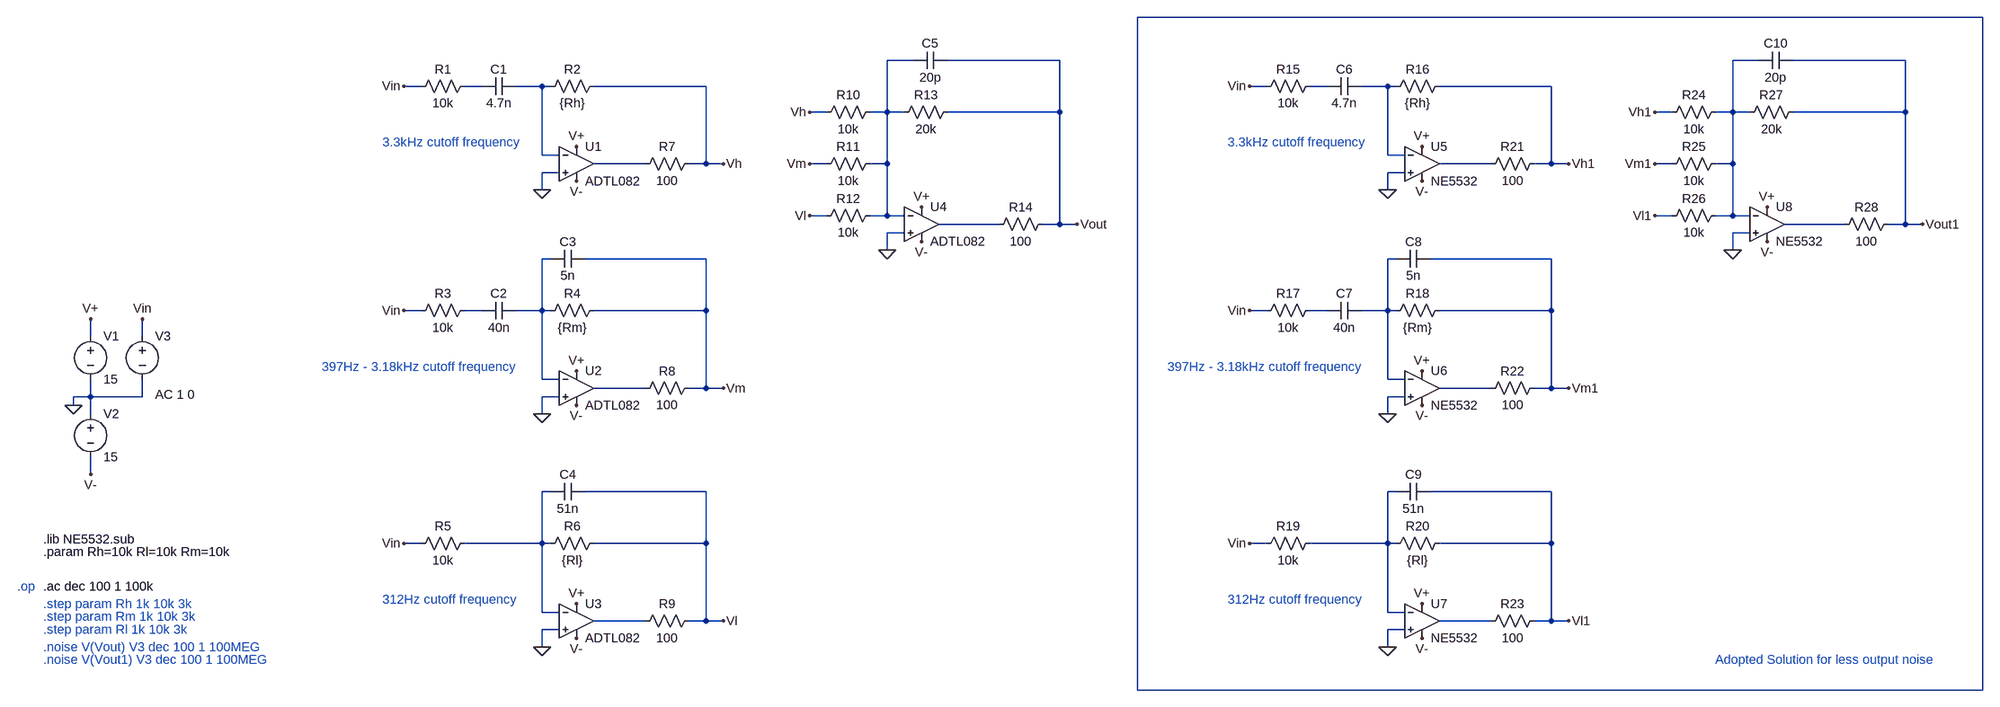
[diagram p0: schematic AudioMixer - 3bEq.asc]
AudioMixer - 3bEq.asc, the LTspice schematic file:
Version 4.1
SHEET 1 2868 2084
WIRE 2864 -576 1296 -576
WIRE 880 -496 832 -496
WIRE 1152 -496 944 -496
WIRE 2448 -496 2400 -496
WIRE 2720 -496 2512 -496
WIRE -32 -448 -64 -448
WIRE 80 -448 48 -448
WIRE 192 -448 144 -448
WIRE 208 -448 192 -448
WIRE 496 -448 288 -448
WIRE 1536 -448 1504 -448
WIRE 1648 -448 1616 -448
WIRE 1760 -448 1712 -448
WIRE 1776 -448 1760 -448
WIRE 2064 -448 1856 -448
WIRE 720 -400 688 -400
WIRE 832 -400 832 -496
WIRE 832 -400 800 -400
WIRE 864 -400 832 -400
WIRE 1152 -400 1152 -496
WIRE 1152 -400 944 -400
WIRE 2288 -400 2256 -400
WIRE 2400 -400 2400 -496
WIRE 2400 -400 2368 -400
WIRE 2432 -400 2400 -400
WIRE 2720 -400 2720 -496
WIRE 2720 -400 2512 -400
WIRE 192 -320 192 -448
WIRE 224 -320 192 -320
WIRE 1760 -320 1760 -448
WIRE 1792 -320 1760 -320
WIRE 384 -304 288 -304
WIRE 496 -304 496 -448
WIRE 496 -304 464 -304
WIRE 528 -304 496 -304
WIRE 720 -304 688 -304
WIRE 832 -304 832 -400
WIRE 832 -304 800 -304
WIRE 1952 -304 1856 -304
WIRE 2064 -304 2064 -448
WIRE 2064 -304 2032 -304
WIRE 2096 -304 2064 -304
WIRE 2288 -304 2256 -304
WIRE 2400 -304 2400 -400
WIRE 2400 -304 2368 -304
WIRE 224 -288 192 -288
WIRE 1792 -288 1760 -288
WIRE 192 -256 192 -288
WIRE 1760 -256 1760 -288
WIRE 720 -208 688 -208
WIRE 832 -208 832 -304
WIRE 832 -208 800 -208
WIRE 864 -208 832 -208
WIRE 2288 -208 2256 -208
WIRE 2400 -208 2400 -304
WIRE 2400 -208 2368 -208
WIRE 2432 -208 2400 -208
WIRE 1040 -192 928 -192
WIRE 1152 -192 1152 -400
WIRE 1152 -192 1120 -192
WIRE 1184 -192 1152 -192
WIRE 2608 -192 2496 -192
WIRE 2720 -192 2720 -400
WIRE 2720 -192 2688 -192
WIRE 2752 -192 2720 -192
WIRE 864 -176 832 -176
WIRE 2432 -176 2400 -176
WIRE 832 -144 832 -176
WIRE 2400 -144 2400 -176
WIRE 208 -128 192 -128
WIRE 496 -128 272 -128
WIRE 1776 -128 1760 -128
WIRE 2064 -128 1840 -128
WIRE -32 -32 -64 -32
WIRE 80 -32 48 -32
WIRE 192 -32 192 -128
WIRE 192 -32 144 -32
WIRE 208 -32 192 -32
WIRE 496 -32 496 -128
WIRE 496 -32 288 -32
WIRE 1536 -32 1504 -32
WIRE 1648 -32 1616 -32
WIRE 1760 -32 1760 -128
WIRE 1760 -32 1712 -32
WIRE 1776 -32 1760 -32
WIRE 2064 -32 2064 -128
WIRE 2064 -32 1856 -32
WIRE -832 16 -832 -16
WIRE -736 16 -736 -16
WIRE 192 96 192 -32
WIRE 224 96 192 96
WIRE 1760 96 1760 -32
WIRE 1792 96 1760 96
WIRE 384 112 288 112
WIRE 496 112 496 -32
WIRE 496 112 464 112
WIRE 528 112 496 112
WIRE 1952 112 1856 112
WIRE 2064 112 2064 -32
WIRE 2064 112 2032 112
WIRE 2096 112 2064 112
WIRE -832 128 -832 96
WIRE -832 128 -864 128
WIRE -736 128 -736 96
WIRE -736 128 -832 128
WIRE 224 128 192 128
WIRE 1792 128 1760 128
WIRE -864 144 -864 128
WIRE -832 160 -832 128
WIRE 192 160 192 128
WIRE 1760 160 1760 128
WIRE -832 272 -832 240
WIRE 208 304 192 304
WIRE 496 304 272 304
WIRE 1776 304 1760 304
WIRE 2064 304 1840 304
WIRE -32 400 -64 400
WIRE 192 400 192 304
WIRE 192 400 48 400
WIRE 208 400 192 400
WIRE 496 400 496 304
WIRE 496 400 288 400
WIRE 1536 400 1504 400
WIRE 1760 400 1760 304
WIRE 1760 400 1616 400
WIRE 1776 400 1760 400
WIRE 2064 400 2064 304
WIRE 2064 400 1856 400
WIRE 192 528 192 400
WIRE 224 528 192 528
WIRE 1760 528 1760 400
WIRE 1792 528 1760 528
WIRE 384 544 288 544
WIRE 496 544 496 400
WIRE 496 544 464 544
WIRE 528 544 496 544
WIRE 1952 544 1856 544
WIRE 2064 544 2064 400
WIRE 2064 544 2032 544
WIRE 2096 544 2064 544
WIRE 224 560 192 560
WIRE 1792 560 1760 560
WIRE 192 592 192 560
WIRE 1760 592 1760 560
WIRE 1296 672 1296 -576
WIRE 2864 672 2864 -576
WIRE 2864 672 1296 672
FLAG -864 144 0
FLAG -832 -16 V+
FLAG -832 272 V-
FLAG 256 -336 V+
FLAG 256 -272 V-
FLAG -736 -16 Vin
FLAG -64 -448 Vin
FLAG 528 -304 Vh
FLAG 192 -256 0
FLAG 256 80 V+
FLAG 256 144 V-
FLAG -64 -32 Vin
FLAG 192 160 0
FLAG 256 512 V+
FLAG 256 576 V-
FLAG -64 400 Vin
FLAG 192 592 0
FLAG 896 -224 V+
FLAG 896 -160 V-
FLAG 832 -144 0
FLAG 528 112 Vm
FLAG 528 544 Vl
FLAG 688 -400 Vh
FLAG 688 -304 Vm
FLAG 688 -208 Vl
FLAG 1824 -336 V+
FLAG 1824 -272 V-
FLAG 1504 -448 Vin
FLAG 2096 -304 Vh1
FLAG 1760 -256 0
FLAG 1824 80 V+
FLAG 1824 144 V-
FLAG 1504 -32 Vin
FLAG 1760 160 0
FLAG 1824 512 V+
FLAG 1824 576 V-
FLAG 1504 400 Vin
FLAG 1760 592 0
FLAG 2464 -224 V+
FLAG 2464 -160 V-
FLAG 2400 -144 0
FLAG 2096 112 Vm1
FLAG 2096 544 Vl1
FLAG 2752 -192 Vout1
FLAG 2256 -400 Vh1
FLAG 2256 -304 Vm1
FLAG 2256 -208 Vl1
FLAG 1184 -192 Vout
SYMBOL OpAmps\\ADTL082 256 -368 R0
SYMATTR InstName U1
SYMBOL voltage -832 0 R0
SYMATTR InstName V1
SYMATTR Value 15
SYMBOL voltage -832 144 R0
SYMATTR InstName V2
SYMATTR Value 15
SYMBOL voltage -736 0 R0
WINDOW 123 24 124 Left 2
WINDOW 39 0 0 Left 0
SYMATTR Value2 AC 1 0
SYMATTR InstName V3
SYMATTR Value ""
SYMBOL res 64 -464 R90
WINDOW 0 0 56 VBottom 2
WINDOW 3 32 56 VTop 2
SYMATTR InstName R1
SYMATTR Value 10k
SYMBOL cap 144 -464 R90
WINDOW 0 0 32 VBottom 2
WINDOW 3 32 32 VTop 2
SYMATTR InstName C1
SYMATTR Value 4.7n
SYMBOL res 304 -464 R90
WINDOW 0 0 56 VBottom 2
WINDOW 3 32 56 VTop 2
SYMATTR InstName R2
SYMATTR Value {Rh}
SYMBOL OpAmps\\ADTL082 256 48 R0
SYMATTR InstName U2
SYMBOL res 64 -48 R90
WINDOW 0 0 56 VBottom 2
WINDOW 3 32 56 VTop 2
SYMATTR InstName R3
SYMATTR Value 10k
SYMBOL cap 144 -48 R90
WINDOW 0 0 32 VBottom 2
WINDOW 3 32 32 VTop 2
SYMATTR InstName C2
SYMATTR Value 40n
SYMBOL res 304 -48 R90
WINDOW 0 0 56 VBottom 2
WINDOW 3 32 56 VTop 2
SYMATTR InstName R4
SYMATTR Value {Rm}
SYMBOL cap 272 -144 R90
WINDOW 0 0 32 VBottom 2
WINDOW 3 32 32 VTop 2
SYMATTR InstName C3
SYMATTR Value 5n
SYMBOL OpAmps\\ADTL082 256 480 R0
SYMATTR InstName U3
SYMBOL res 64 384 R90
WINDOW 0 0 56 VBottom 2
WINDOW 3 32 56 VTop 2
SYMATTR InstName R5
SYMATTR Value 10k
SYMBOL res 304 384 R90
WINDOW 0 0 56 VBottom 2
WINDOW 3 32 56 VTop 2
SYMATTR InstName R6
SYMATTR Value {Rl}
SYMBOL cap 272 288 R90
WINDOW 0 0 32 VBottom 2
WINDOW 3 32 32 VTop 2
SYMATTR InstName C4
SYMATTR Value 51n
SYMBOL OpAmps\\ADTL082 896 -256 R0
SYMATTR InstName U4
SYMBOL res 480 -320 R90
WINDOW 0 0 56 VBottom 2
WINDOW 3 32 56 VTop 2
SYMATTR InstName R7
SYMATTR Value 100
SYMBOL res 480 96 R90
WINDOW 0 0 56 VBottom 2
WINDOW 3 32 56 VTop 2
SYMATTR InstName R8
SYMATTR Value 100
SYMBOL res 480 528 R90
WINDOW 0 0 56 VBottom 2
WINDOW 3 32 56 VTop 2
SYMATTR InstName R9
SYMATTR Value 100
SYMBOL res 816 -416 R90
WINDOW 0 0 56 VBottom 2
WINDOW 3 32 56 VTop 2
SYMATTR InstName R10
SYMATTR Value 10k
SYMBOL res 816 -320 R90
WINDOW 0 0 56 VBottom 2
WINDOW 3 32 56 VTop 2
SYMATTR InstName R11
SYMATTR Value 10k
SYMBOL res 816 -224 R90
WINDOW 0 0 56 VBottom 2
WINDOW 3 32 56 VTop 2
SYMATTR InstName R12
SYMATTR Value 10k
SYMBOL res 960 -416 R90
WINDOW 0 0 56 VBottom 2
WINDOW 3 32 56 VTop 2
SYMATTR InstName R13
SYMATTR Value 20k
SYMBOL cap 944 -512 R90
WINDOW 0 0 32 VBottom 2
WINDOW 3 32 32 VTop 2
SYMATTR InstName C5
SYMATTR Value 20p
SYMBOL res 1136 -208 R90
WINDOW 0 0 56 VBottom 2
WINDOW 3 32 56 VTop 2
SYMATTR InstName R14
SYMATTR Value 100
SYMBOL res 1632 -464 R90
WINDOW 0 0 56 VBottom 2
WINDOW 3 32 56 VTop 2
SYMATTR InstName R15
SYMATTR Value 10k
SYMBOL cap 1712 -464 R90
WINDOW 0 0 32 VBottom 2
WINDOW 3 32 32 VTop 2
SYMATTR InstName C6
SYMATTR Value 4.7n
SYMBOL res 1872 -464 R90
WINDOW 0 0 56 VBottom 2
WINDOW 3 32 56 VTop 2
SYMATTR InstName R16
SYMATTR Value {Rh}
SYMBOL res 1632 -48 R90
WINDOW 0 0 56 VBottom 2
WINDOW 3 32 56 VTop 2
SYMATTR InstName R17
SYMATTR Value 10k
SYMBOL cap 1712 -48 R90
WINDOW 0 0 32 VBottom 2
WINDOW 3 32 32 VTop 2
SYMATTR InstName C7
SYMATTR Value 40n
SYMBOL res 1872 -48 R90
WINDOW 0 0 56 VBottom 2
WINDOW 3 32 56 VTop 2
SYMATTR InstName R18
SYMATTR Value {Rm}
SYMBOL cap 1840 -144 R90
WINDOW 0 0 32 VBottom 2
WINDOW 3 32 32 VTop 2
SYMATTR InstName C8
SYMATTR Value 5n
SYMBOL res 1632 384 R90
WINDOW 0 0 56 VBottom 2
WINDOW 3 32 56 VTop 2
SYMATTR InstName R19
SYMATTR Value 10k
SYMBOL res 1872 384 R90
WINDOW 0 0 56 VBottom 2
WINDOW 3 32 56 VTop 2
SYMATTR InstName R20
SYMATTR Value {Rl}
SYMBOL cap 1840 288 R90
WINDOW 0 0 32 VBottom 2
WINDOW 3 32 32 VTop 2
SYMATTR InstName C9
SYMATTR Value 51n
SYMBOL res 2048 -320 R90
WINDOW 0 0 56 VBottom 2
WINDOW 3 32 56 VTop 2
SYMATTR InstName R21
SYMATTR Value 100
SYMBOL res 2048 96 R90
WINDOW 0 0 56 VBottom 2
WINDOW 3 32 56 VTop 2
SYMATTR InstName R22
SYMATTR Value 100
SYMBOL res 2048 528 R90
WINDOW 0 0 56 VBottom 2
WINDOW 3 32 56 VTop 2
SYMATTR InstName R23
SYMATTR Value 100
SYMBOL res 2384 -416 R90
WINDOW 0 0 56 VBottom 2
WINDOW 3 32 56 VTop 2
SYMATTR InstName R24
SYMATTR Value 10k
SYMBOL res 2384 -320 R90
WINDOW 0 0 56 VBottom 2
WINDOW 3 32 56 VTop 2
SYMATTR InstName R25
SYMATTR Value 10k
SYMBOL res 2384 -224 R90
WINDOW 0 0 56 VBottom 2
WINDOW 3 32 56 VTop 2
SYMATTR InstName R26
SYMATTR Value 10k
SYMBOL res 2528 -416 R90
WINDOW 0 0 56 VBottom 2
WINDOW 3 32 56 VTop 2
SYMATTR InstName R27
SYMATTR Value 20k
SYMBOL cap 2512 -512 R90
WINDOW 0 0 32 VBottom 2
WINDOW 3 32 32 VTop 2
SYMATTR InstName C10
SYMATTR Value 20p
SYMBOL res 2704 -208 R90
WINDOW 0 0 56 VBottom 2
WINDOW 3 32 56 VTop 2
SYMATTR InstName R28
SYMATTR Value 100
SYMBOL OpAmps\\opamp2 1824 -368 R0
SYMATTR InstName U5
SYMATTR Value NE5532
SYMBOL OpAmps\\opamp2 1824 48 R0
SYMATTR InstName U6
SYMATTR Value NE5532
SYMBOL OpAmps\\opamp2 1824 480 R0
SYMATTR InstName U7
SYMATTR Value NE5532
SYMBOL OpAmps\\opamp2 2464 -256 R0
SYMATTR InstName U8
SYMATTR Value NE5532
TEXT -920 480 Left 2 !.ac dec 100 1 100k
TEXT -920 416 Left 2 !.param Rh=10k Rl=10k Rm=10k
TEXT -920 512 Left 2 ;.step param Rh 1k 10k 3k
TEXT -920 536 Left 2 ;.step param Rm 1k 10k 3k
TEXT -920 560 Left 2 ;.step param Rl 1k 10k 3k
TEXT -104 -344 Left 2 ;3.3kHz cutoff frequency
TEXT -216 72 Left 2 ;397Hz - 3.18kHz cutoff frequency
TEXT -104 504 Left 2 ;312Hz cutoff frequency
TEXT -920 392 Left 2 !.lib NE5532.sub
TEXT -968 480 Left 2 ;.op
TEXT -920 592 Left 2 ;.noise V(Vout) V3 dec 100 1 100MEG
TEXT 1464 -344 Left 2 ;3.3kHz cutoff frequency
TEXT 1352 72 Left 2 ;397Hz - 3.18kHz cutoff frequency
TEXT 1464 504 Left 2 ;312Hz cutoff frequency
TEXT -920 616 Left 2 ;.noise V(Vout1) V3 dec 100 1 100MEG
TEXT 2368 616 Left 2 ;Adopted Solution for less output noise

The netlist it stands for:
* AudioMixer - 3bEq.asc
X§U1 0 N005 V+ V- N008 ADTL082  ; pins In+ In- V+ V- OUT
V1 V+ 0 15
V2 0 V- 15
V3 Vin 0 AC 1 0
R1 N004 Vin 10k
C1 N005 N004 4.7n
R2 Vh N005 {Rh}
X§U2 0 N012 V+ V- N016 ADTL082  ; pins In+ In- V+ V- OUT
R3 N014 Vin 10k
C2 N012 N014 40n
R4 Vm N012 {Rm}
C3 Vm N012 5n
X§U3 0 N018 V+ V- N020 ADTL082  ; pins In+ In- V+ V- OUT
R5 N018 Vin 10k
R6 Vl N018 {Rl}
C4 Vl N018 51n
X§U4 0 N002 V+ V- N010 ADTL082  ; pins In+ In- V+ V- OUT
R7 Vh N008 100
R8 Vm N016 100
R9 Vl N020 100
R10 N002 Vh 10k
R11 N002 Vm 10k
R12 N002 Vl 10k
R13 Vout N002 20k
C5 Vout N002 20p
R14 Vout N010 100
R15 N006 Vin 10k
C6 N007 N006 4.7n
R16 Vh1 N007 {Rh}
R17 N015 Vin 10k
C7 N013 N015 40n
R18 Vm1 N013 {Rm}
C8 Vm1 N013 5n
R19 N019 Vin 10k
R20 Vl1 N019 {Rl}
C9 Vl1 N019 51n
R21 Vh1 N009 100
R22 Vm1 N017 100
R23 Vl1 N021 100
R24 N003 Vh1 10k
R25 N003 Vm1 10k
R26 N003 Vl1 10k
R27 Vout1 N003 20k
C10 Vout1 N003 20p
R28 Vout1 N011 100
X§U5 0 N007 V+ V- N009 NE5532  ; pins In+ In- V+ V- OUT
X§U6 0 N013 V+ V- N017 NE5532  ; pins In+ In- V+ V- OUT
X§U7 0 N019 V+ V- N021 NE5532  ; pins In+ In- V+ V- OUT
X§U8 0 N003 V+ V- N011 NE5532  ; pins In+ In- V+ V- OUT
.ac dec 100 1 100k
.param Rh=10k Rl=10k Rm=10k
* .step param Rh 1k 10k 3k
* .step param Rm 1k 10k 3k
* .step param Rl 1k 10k 3k
* 3.3kHz cutoff frequency
* 397Hz - 3.18kHz cutoff frequency
* 312Hz cutoff frequency
.lib NE5532.sub
* .op
* .noise V(Vout) V3 dec 100 1 100MEG
* 3.3kHz cutoff frequency
* 397Hz - 3.18kHz cutoff frequency
* 312Hz cutoff frequency
* .noise V(Vout1) V3 dec 100 1 100MEG
* Adopted Solution for less output noise
.lib ADI.lib
.backanno
.end